# Altium schematic sheet PrimarySide.SchDoc
size A; SheetNumber: 1; SheetTotal: 2
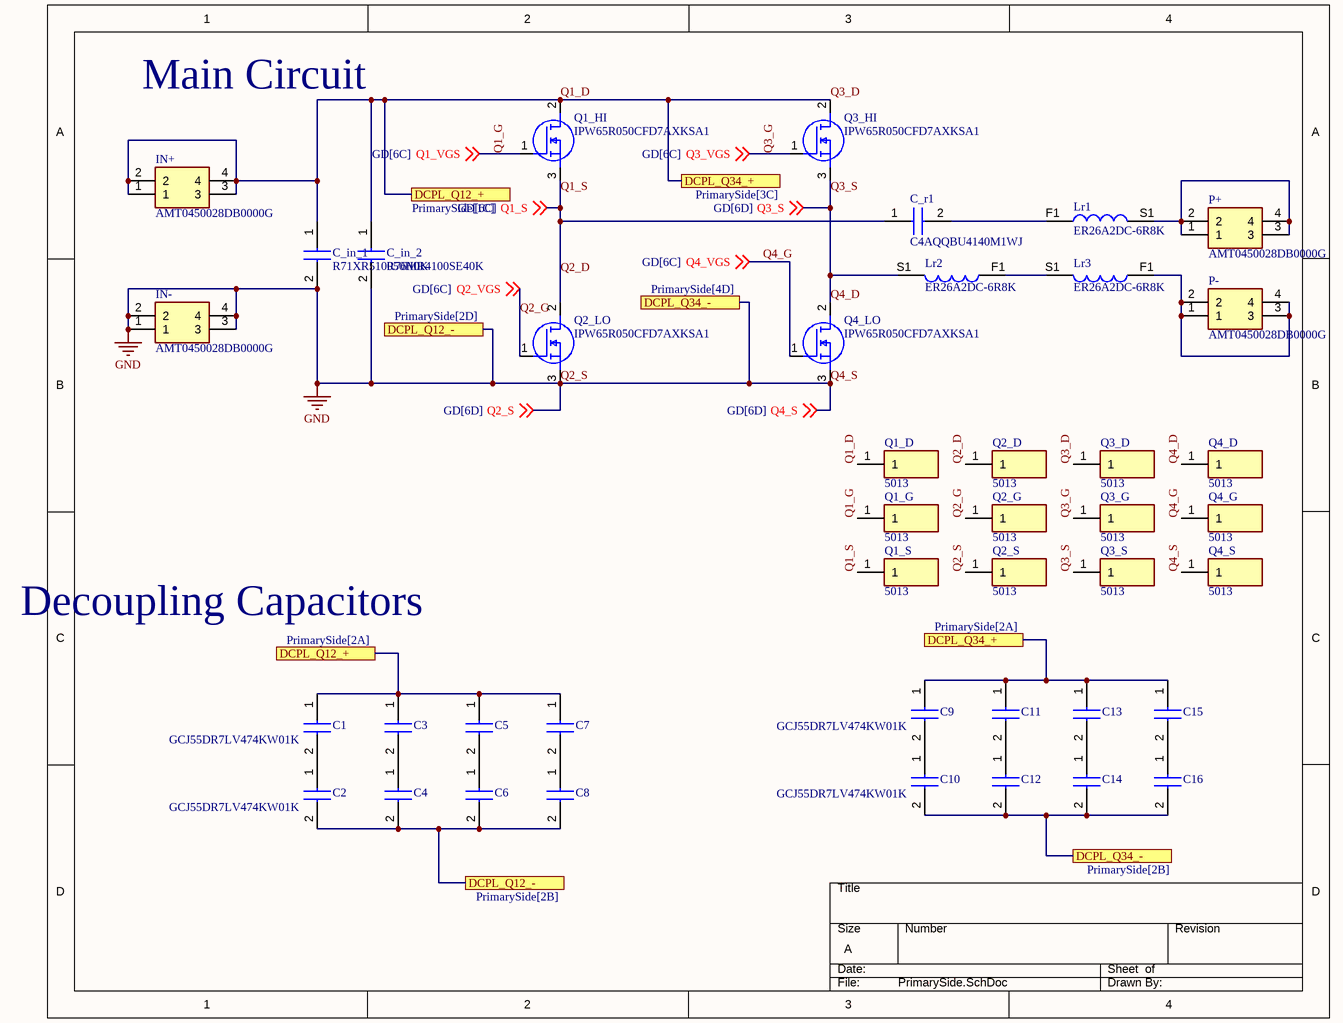
[diagram p0: PrimarySide.SchDoc]

## Parts
C1  GCJ55DR7LV474KW01K  [GCJ55D]
C2  GCJ55DR7LV474KW01K  [GCJ55D]
C3  GCJ55DR7LV474KW01K  [GCJ55D]  (value not drawn)
C4  GCJ55DR7LV474KW01K  [GCJ55D]  (value not drawn)
C5  GCJ55DR7LV474KW01K  [GCJ55D]  (value not drawn)
C6  GCJ55DR7LV474KW01K  [GCJ55D]  (value not drawn)
C7  GCJ55DR7LV474KW01K  [GCJ55D]  (value not drawn)
C8  GCJ55DR7LV474KW01K  [GCJ55D]  (value not drawn)
C9  GCJ55DR7LV474KW01K  [GCJ55D]
C10  GCJ55DR7LV474KW01K  [GCJ55D]
C11  GCJ55DR7LV474KW01K  [GCJ55D]  (value not drawn)
C12  GCJ55DR7LV474KW01K  [GCJ55D]  (value not drawn)
C13  GCJ55DR7LV474KW01K  [GCJ55D]  (value not drawn)
C14  GCJ55DR7LV474KW01K  [GCJ55D]  (value not drawn)
C15  GCJ55DR7LV474KW01K  [GCJ55D]  (value not drawn)
C16  GCJ55DR7LV474KW01K  [GCJ55D]  (value not drawn)
C_in_1  R71XR510050H0K  [R71XR510050H0K]
C_in_2  R76MR4100SE40K  [R76MR4100SE40K]
C_r1  C4AQQBU4140M1WJ  [C4AQQBU4140M1WJ]
IN+  AMT0450028DB0000G  [AMT0450028DB0000G]
IN-  AMT0450028DB0000G  [AMT0450028DB0000G]
Lr1  ER26A2DC-6R8K  [ER26A2DC6R8K]
Lr2  ER26A2DC-6R8K  [ER26A2DC6R8K]
Lr3  ER26A2DC-6R8K  [ER26A2DC6R8K]
P+  AMT0450028DB0000G  [AMT0450028DB0000G]
P-  AMT0450028DB0000G  [AMT0450028DB0000G]
Q1_D  5013  [5013]
Q1_G  5013  [5013]
Q1_HI  IPW65R050CFD7AXKSA1  [TO544P530X1590X2600-3P]
Q1_S  5013  [5013]
Q2_D  5013  [5013]
Q2_G  5013  [5013]
Q2_LO  IPW65R050CFD7AXKSA1  [TO544P530X1590X2600-3P]
Q2_S  5013  [5013]
Q3_D  5013  [5013]
Q3_G  5013  [5013]
Q3_HI  IPW65R050CFD7AXKSA1  [TO544P530X1590X2600-3P]
Q3_S  5013  [5013]
Q4_D  5013  [5013]
Q4_G  5013  [5013]
Q4_LO  IPW65R050CFD7AXKSA1  [TO544P530X1590X2600-3P]
Q4_S  5013  [5013]

## Ports
DCPL_Q12_+ (see PrimarySide[1C]), DCPL_Q12_+ (see PrimarySide[2A]), DCPL_Q12_- (see PrimarySide[2B]), DCPL_Q12_- (see PrimarySide[2D]), DCPL_Q34_+ (see PrimarySide[2A]), DCPL_Q34_+ (see PrimarySide[3C]), DCPL_Q34_- (see PrimarySide[2B]), DCPL_Q34_- (see PrimarySide[4D])

## Nets
Q2_S: C2.2 C4.2 C6.2 C8.2 C10.2 C12.2 C14.2 C16.2 C_in_1.2 C_in_2.2 IN-.1 IN-.2 IN-.3 IN-.4 Q2_LO.3(S) Q2_S.1 Q4_LO.3(S) Q4_S.1 ; off-sheet Q2_S, off-sheet Q4_S, port DCPL_Q12_-, port DCPL_Q34_-  [also labelled GND, Q4_S]
Q1_D: C1.1 C3.1 C5.1 C7.1 C9.1 C11.1 C13.1 C15.1 C_in_1.1 C_in_2.1 IN+.1 IN+.2 IN+.3 IN+.4 Q1_D.1 Q1_HI.2(D) Q3_D.1 Q3_HI.2(D) ; port DCPL_Q12_+, port DCPL_Q34_+  [also labelled Q3_D]
Q1_G: Q1_G.1 Q1_HI.1(G) ; off-sheet Q1_VGS  [also labelled Q1_VGS]
Q1_S: C_r1.1 Q1_HI.3(S) Q1_S.1 Q2_D.1 Q2_LO.2(D) ; off-sheet Q1_S  [also labelled Q2_D]
Q2_G: Q2_G.1 Q2_LO.1(G) ; off-sheet Q2_VGS  [also labelled Q2_VGS]
Q3_G: Q3_G.1 Q3_HI.1(G) ; off-sheet Q3_VGS  [also labelled Q3_VGS]
Q3_S: Lr2.S1 Q3_HI.3(S) Q3_S.1 Q4_D.1 Q4_LO.2(D) ; off-sheet Q3_S  [also labelled Q4_D]
Q4_G: Q4_G.1 Q4_LO.1(G) ; off-sheet Q4_VGS  [also labelled Q4_VGS]
NetC1_2: C1.2 C2.1
NetC3_2: C3.2 C4.1
NetC5_2: C5.2 C6.1
NetC7_2: C7.2 C8.1
NetC9_2: C9.2 C10.1
NetC11_2: C11.2 C12.1
NetC13_2: C13.2 C14.1
NetC15_2: C15.2 C16.1
NetC_r1_2: C_r1.2 Lr1.F1
NetLr1_S1: Lr1.S1 P+.1 P+.2 P+.3 P+.4
NetLr2_F1: Lr2.F1 Lr3.S1
NetLr3_F1: Lr3.F1 P-.1 P-.2 P-.3 P-.4

## Notes on the sheet
- Main Circuit
- Decoupling Capacitors

## Library data of the parts
C1-C16 = GCJ55DR7LV474KW01K: Capacitor; Manufacturer_Name: Murata Electronics; Datasheet Link: https://search.murata.co.jp/Ceramy/image/img/A01X/G101/ENG/GCJ55DR7LV474KW01-00B.pdf; Height: 2mm; Manufacturer_Part_Number: GCJ55DR7LV474KW01K; Mouser Part Number: 81-GCJ55D7LV474KW01K; Mouser Price/Stock: https://www.mouser.co.uk/ProductDetail/Murata-Electronics/GCJ55DR7LV474KW01K?qs=By6Nw2ByBD00cj4z4sTn5Q%3D%3D
C_in_1 = R71XR510050H0K: Capacitor; Manufacturer_Name: KEMET; Datasheet Link: https://content.kemet.com/datasheets/KEM_F3130_R71H.pdf; Height: 28.1mm; Manufacturer_Part_Number: R71XR510050H0K; Mouser Part Number: 80-R71XR510050H0K; Mouser Price/Stock: https://www.mouser.co.uk/ProductDetail/KEMET/R71XR510050H0K?qs=Jslch3jnSjmgqBZUL0Ww4w%3D%3D; Arrow Part Number: R71XR510050H0K; Arrow Price/Stock: https://www.arrow.com/en/products/r71xr510050h0k/kemet-corporation?region=europe
C_in_2 = R76MR4100SE40K: Capacitor; Manufacturer_Name: KEMET; Datasheet Link: https://search.kemet.com/component-documentation/download/specsheet/R76MR4100SE40K; Height: 22.1mm; Manufacturer_Part_Number: R76MR4100SE40K; Mouser Part Number: 80-R76MR4100SE40K; Mouser Price/Stock: https://www.mouser.com/Search/Refine.aspx?Keyword=80-R76MR4100SE40K; Arrow Part Number: R76MR4100SE40K; Arrow Price/Stock: https://www.arrow.com/en/products/r76mr4100se40k/kemet-corporation
C_r1 = C4AQQBU4140M1WJ: Capacitor; Manufacturer_Name: KEMET; Datasheet Link: https://search.kemet.com/component-documentation/download/specsheet/C4AQQBU4140M1WJ; Height: 20.2mm; Manufacturer_Part_Number: C4AQQBU4140M1WJ; Mouser Part Number: 80-C4AQQBU4140M1WJ; Mouser Price/Stock: https://www.mouser.co.uk/ProductDetail/KEMET/C4AQQBU4140M1WJ?qs=81r%252BiQLm7BSMlBltxrghzA%3D%3D
IN+ IN- P+ P- = AMT0450028DB0000G: Connector; Manufacturer_Name: Amphenol; Datasheet Link: https://www.anytek.com.cn/Upload/AMT45028DB-821f25108d7e4e0caa268ff3448ada5b.pdf; Height: 7.4mm; Manufacturer_Part_Number: AMT0450028DB0000G; Mouser Part Number: 523-AMT0450028DB000G; Mouser Price/Stock: https://www.mouser.co.uk/ProductDetail/Amphenol-Anytek/AMT0450028DB0000G?qs=ST9lo4GX8V0in%252BhOLfQ9xA%3D%3D
Lr1-Lr3 = ER26A2DC-6R8K: Inductor; Manufacturer_Name: Bourns; Datasheet Link: https://www.bourns.com/docs/product-datasheets/er26a.pdf; Height: 17mm; Manufacturer_Part_Number: ER26A2DC-6R8K
Q1_D Q1_G Q1_S Q2_D Q2_G Q2_S Q3_D Q3_G Q3_S Q4_D Q4_G Q4_S = 5013: Test Point; Manufacturer_Name: Keystone Electronics; Datasheet Link: http://www.keyelco.com/product-pdf.cfm?p=1322; Height: 8.28mm; Manufacturer_Part_Number: 5013; Mouser Part Number: 534-5013; Mouser Price/Stock: https://www.mouser.co.uk/ProductDetail/Keystone-Electronics/5013?qs=qOqV1E1P08RLig9vMFtXag%3D%3D
Q1_HI Q2_LO Q3_HI Q4_LO = IPW65R050CFD7AXKSA1: MOSFET (N-Channel); Manufacturer_Name: Infineon; Datasheet Link: https://www.infineon.com/dgdl/Infineon-IPW65R050CFD7A-DataSheet-v02_01-EN.pdf?fileId=5546d46271bf4f920171c0167ea2084c; Height: 5.3mm; Manufacturer_Part_Number: IPW65R050CFD7AXKSA1; Mouser Part Number: 726-IPW65R050CFD7AXK; Mouser Price/Stock: https://www.mouser.co.uk/ProductDetail/Infineon-Technologies/IPW65R050CFD7AXKSA1?qs=OlC7AqGiEDm4ztoS376shw%3D%3D; Arrow Part Number: IPW65R050CFD7AXKSA1; Arrow Price/Stock: https://www.arrow.com/en/products/ipw65r050cfd7axksa1/infineon-technologies-ag?region=europe